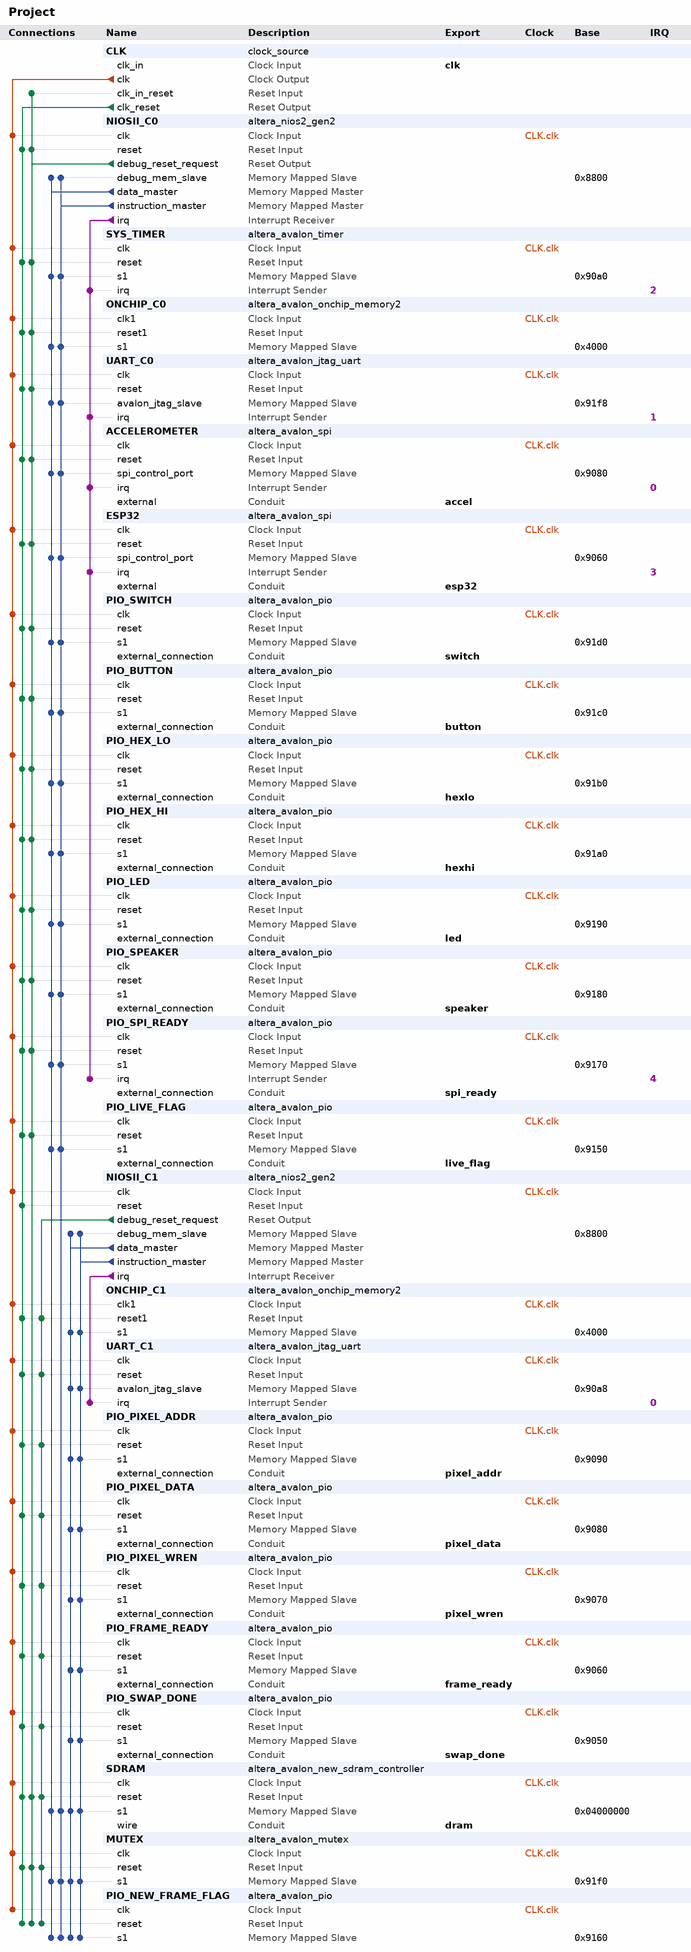
[diagram p0: system contents]
# Platform Designer (Qsys) system Project, MAX 10 10M50DAF484C7G
# Parameters at their usual value, and those the tool derives, are not listed.
package require -exact qsys 23.1
create_system Project
set_project_property DEVICE_FAMILY {MAX 10}
set_project_property DEVICE 10M50DAF484C7G

add_instance CLK clock_source 23.1
set_instance_parameter_value CLK clockFrequency 50000000

add_instance NIOSII_C0 altera_nios2_gen2 23.1
set_instance_parameter_value NIOSII_C0 dcache_size 2048
set_instance_parameter_value NIOSII_C0 exceptionSlave ONCHIP_C0.s1
set_instance_parameter_value NIOSII_C0 icache_size 4096
set_instance_parameter_value NIOSII_C0 impl Fast
set_instance_parameter_value NIOSII_C0 resetSlave ONCHIP_C0.s1

add_instance SYS_TIMER altera_avalon_timer 23.1
set_instance_parameter_value SYS_TIMER alwaysRun true
set_instance_parameter_value SYS_TIMER fixedPeriod true
set_instance_parameter_value SYS_TIMER period 1
set_instance_parameter_value SYS_TIMER periodUnits MSEC

add_instance ONCHIP_C0 altera_avalon_onchip_memory2 23.1
set_instance_parameter_value ONCHIP_C0 dataWidth 32
set_instance_parameter_value ONCHIP_C0 dualPort false
set_instance_parameter_value ONCHIP_C0 initMemContent false
set_instance_parameter_value ONCHIP_C0 initializationFileName onchip_mem.hex
set_instance_parameter_value ONCHIP_C0 memorySize 16384

add_instance UART_C0 altera_avalon_jtag_uart 23.1
set_instance_parameter_value UART_C0 simInteractiveOptions NO_INTERACTIVE_WINDOWS

add_instance ACCELEROMETER altera_avalon_spi 23.1
set_instance_parameter_value ACCELEROMETER clockPhase 1
set_instance_parameter_value ACCELEROMETER clockPolarity 1
set_instance_parameter_value ACCELEROMETER dataWidth 8
set_instance_parameter_value ACCELEROMETER masterSPI true
set_instance_parameter_value ACCELEROMETER numberOfSlaves 1
set_instance_parameter_value ACCELEROMETER targetClockRate 128000

add_instance ESP32 altera_avalon_spi 23.1
set_instance_parameter_value ESP32 clockPolarity 0
set_instance_parameter_value ESP32 dataWidth 8
set_instance_parameter_value ESP32 masterSPI true
set_instance_parameter_value ESP32 numberOfSlaves 1
set_instance_parameter_value ESP32 targetClockRate 600000000

add_instance PIO_SWITCH altera_avalon_pio 23.1
set_instance_parameter_value PIO_SWITCH direction Input
set_instance_parameter_value PIO_SWITCH width 5

add_instance PIO_BUTTON altera_avalon_pio 23.1
set_instance_parameter_value PIO_BUTTON direction Input
set_instance_parameter_value PIO_BUTTON edgeType FALLING
set_instance_parameter_value PIO_BUTTON width 2

add_instance PIO_HEX_LO altera_avalon_pio 23.1
set_instance_parameter_value PIO_HEX_LO direction Output
set_instance_parameter_value PIO_HEX_LO width 24

add_instance PIO_HEX_HI altera_avalon_pio 23.1
set_instance_parameter_value PIO_HEX_HI direction Output
set_instance_parameter_value PIO_HEX_HI width 24

add_instance PIO_LED altera_avalon_pio 23.1
set_instance_parameter_value PIO_LED direction Output
set_instance_parameter_value PIO_LED width 5

add_instance PIO_SPEAKER altera_avalon_pio 23.1
set_instance_parameter_value PIO_SPEAKER direction Output
set_instance_parameter_value PIO_SPEAKER width 1

add_instance PIO_SPI_READY altera_avalon_pio 23.1
set_instance_parameter_value PIO_SPI_READY captureEdge true
set_instance_parameter_value PIO_SPI_READY direction Input
set_instance_parameter_value PIO_SPI_READY generateIRQ true
set_instance_parameter_value PIO_SPI_READY irqType EDGE
set_instance_parameter_value PIO_SPI_READY width 1

add_instance PIO_LIVE_FLAG altera_avalon_pio 23.1
set_instance_parameter_value PIO_LIVE_FLAG direction Output
set_instance_parameter_value PIO_LIVE_FLAG width 1

add_instance NIOSII_C1 altera_nios2_gen2 23.1
set_instance_parameter_value NIOSII_C1 cpuID 1
set_instance_parameter_value NIOSII_C1 dcache_size 2048
set_instance_parameter_value NIOSII_C1 exceptionSlave ONCHIP_C1.s1
set_instance_parameter_value NIOSII_C1 icache_size 4096
set_instance_parameter_value NIOSII_C1 impl Fast
set_instance_parameter_value NIOSII_C1 resetSlave ONCHIP_C1.s1

add_instance ONCHIP_C1 altera_avalon_onchip_memory2 23.1
set_instance_parameter_value ONCHIP_C1 dataWidth 32
set_instance_parameter_value ONCHIP_C1 dualPort false
set_instance_parameter_value ONCHIP_C1 initMemContent false
set_instance_parameter_value ONCHIP_C1 initializationFileName onchip_mem.hex
set_instance_parameter_value ONCHIP_C1 memorySize 16384

add_instance UART_C1 altera_avalon_jtag_uart 23.1
set_instance_parameter_value UART_C1 simInteractiveOptions NO_INTERACTIVE_WINDOWS

add_instance PIO_PIXEL_ADDR altera_avalon_pio 23.1
set_instance_parameter_value PIO_PIXEL_ADDR direction Output
set_instance_parameter_value PIO_PIXEL_ADDR width 17

add_instance PIO_PIXEL_DATA altera_avalon_pio 23.1
set_instance_parameter_value PIO_PIXEL_DATA direction Output
set_instance_parameter_value PIO_PIXEL_DATA width 12

add_instance PIO_PIXEL_WREN altera_avalon_pio 23.1
set_instance_parameter_value PIO_PIXEL_WREN direction Output
set_instance_parameter_value PIO_PIXEL_WREN width 1

add_instance PIO_FRAME_READY altera_avalon_pio 23.1
set_instance_parameter_value PIO_FRAME_READY direction Output
set_instance_parameter_value PIO_FRAME_READY width 1

add_instance PIO_SWAP_DONE altera_avalon_pio 23.1
set_instance_parameter_value PIO_SWAP_DONE direction Input
set_instance_parameter_value PIO_SWAP_DONE width 8

add_instance SDRAM altera_avalon_new_sdram_controller 20.1
set_instance_parameter_value SDRAM TAC 5.5
set_instance_parameter_value SDRAM TRCD 20.0
set_instance_parameter_value SDRAM TRP 20.0
set_instance_parameter_value SDRAM casLatency 3
set_instance_parameter_value SDRAM columnWidth 10
set_instance_parameter_value SDRAM dataWidth 16
set_instance_parameter_value SDRAM generateSimulationModel false
set_instance_parameter_value SDRAM model single_Micron_MT48LC4M32B2_7_chip
set_instance_parameter_value SDRAM numberOfBanks 4
set_instance_parameter_value SDRAM numberOfChipSelects 1
set_instance_parameter_value SDRAM powerUpDelay 100.0
set_instance_parameter_value SDRAM refreshPeriod 15.625
set_instance_parameter_value SDRAM rowWidth 13

add_instance MUTEX altera_avalon_mutex 23.1

add_instance PIO_NEW_FRAME_FLAG altera_avalon_pio 23.1
set_instance_parameter_value PIO_NEW_FRAME_FLAG direction Output
set_instance_parameter_value PIO_NEW_FRAME_FLAG width 1

# connections
add_connection CLK.clk ACCELEROMETER.clk clock
add_connection CLK.clk ESP32.clk clock
add_connection CLK.clk MUTEX.clk clock
add_connection CLK.clk NIOSII_C0.clk clock
add_connection CLK.clk NIOSII_C1.clk clock
add_connection CLK.clk ONCHIP_C0.clk1 clock
add_connection CLK.clk ONCHIP_C1.clk1 clock
add_connection CLK.clk PIO_BUTTON.clk clock
add_connection CLK.clk PIO_FRAME_READY.clk clock
add_connection CLK.clk PIO_HEX_HI.clk clock
add_connection CLK.clk PIO_HEX_LO.clk clock
add_connection CLK.clk PIO_LED.clk clock
add_connection CLK.clk PIO_LIVE_FLAG.clk clock
add_connection CLK.clk PIO_NEW_FRAME_FLAG.clk clock
add_connection CLK.clk PIO_PIXEL_ADDR.clk clock
add_connection CLK.clk PIO_PIXEL_DATA.clk clock
add_connection CLK.clk PIO_PIXEL_WREN.clk clock
add_connection CLK.clk PIO_SPEAKER.clk clock
add_connection CLK.clk PIO_SPI_READY.clk clock
add_connection CLK.clk PIO_SWAP_DONE.clk clock
add_connection CLK.clk PIO_SWITCH.clk clock
add_connection CLK.clk SDRAM.clk clock
add_connection CLK.clk SYS_TIMER.clk clock
add_connection CLK.clk UART_C0.clk clock
add_connection CLK.clk UART_C1.clk clock
add_connection CLK.clk_reset ACCELEROMETER.reset reset
add_connection CLK.clk_reset ESP32.reset reset
add_connection CLK.clk_reset MUTEX.reset reset
add_connection CLK.clk_reset NIOSII_C0.reset reset
add_connection CLK.clk_reset NIOSII_C1.reset reset
add_connection CLK.clk_reset ONCHIP_C0.reset1 reset
add_connection CLK.clk_reset ONCHIP_C1.reset1 reset
add_connection CLK.clk_reset PIO_BUTTON.reset reset
add_connection CLK.clk_reset PIO_FRAME_READY.reset reset
add_connection CLK.clk_reset PIO_HEX_HI.reset reset
add_connection CLK.clk_reset PIO_HEX_LO.reset reset
add_connection CLK.clk_reset PIO_LED.reset reset
add_connection CLK.clk_reset PIO_LIVE_FLAG.reset reset
add_connection CLK.clk_reset PIO_NEW_FRAME_FLAG.reset reset
add_connection CLK.clk_reset PIO_PIXEL_ADDR.reset reset
add_connection CLK.clk_reset PIO_PIXEL_DATA.reset reset
add_connection CLK.clk_reset PIO_PIXEL_WREN.reset reset
add_connection CLK.clk_reset PIO_SPEAKER.reset reset
add_connection CLK.clk_reset PIO_SPI_READY.reset reset
add_connection CLK.clk_reset PIO_SWAP_DONE.reset reset
add_connection CLK.clk_reset PIO_SWITCH.reset reset
add_connection CLK.clk_reset SDRAM.reset reset
add_connection CLK.clk_reset SYS_TIMER.reset reset
add_connection CLK.clk_reset UART_C0.reset reset
add_connection CLK.clk_reset UART_C1.reset reset
add_connection NIOSII_C0.debug_reset_request ACCELEROMETER.reset reset
add_connection NIOSII_C0.debug_reset_request CLK.clk_in_reset reset
add_connection NIOSII_C0.debug_reset_request ESP32.reset reset
add_connection NIOSII_C0.debug_reset_request MUTEX.reset reset
add_connection NIOSII_C0.debug_reset_request NIOSII_C0.reset reset
add_connection NIOSII_C0.debug_reset_request ONCHIP_C0.reset1 reset
add_connection NIOSII_C0.debug_reset_request PIO_BUTTON.reset reset
add_connection NIOSII_C0.debug_reset_request PIO_HEX_HI.reset reset
add_connection NIOSII_C0.debug_reset_request PIO_HEX_LO.reset reset
add_connection NIOSII_C0.debug_reset_request PIO_LED.reset reset
add_connection NIOSII_C0.debug_reset_request PIO_LIVE_FLAG.reset reset
add_connection NIOSII_C0.debug_reset_request PIO_NEW_FRAME_FLAG.reset reset
add_connection NIOSII_C0.debug_reset_request PIO_SPEAKER.reset reset
add_connection NIOSII_C0.debug_reset_request PIO_SPI_READY.reset reset
add_connection NIOSII_C0.debug_reset_request PIO_SWITCH.reset reset
add_connection NIOSII_C0.debug_reset_request SDRAM.reset reset
add_connection NIOSII_C0.debug_reset_request SYS_TIMER.reset reset
add_connection NIOSII_C0.debug_reset_request UART_C0.reset reset
add_connection NIOSII_C1.debug_reset_request MUTEX.reset reset
add_connection NIOSII_C1.debug_reset_request ONCHIP_C1.reset1 reset
add_connection NIOSII_C1.debug_reset_request PIO_FRAME_READY.reset reset
add_connection NIOSII_C1.debug_reset_request PIO_NEW_FRAME_FLAG.reset reset
add_connection NIOSII_C1.debug_reset_request PIO_PIXEL_ADDR.reset reset
add_connection NIOSII_C1.debug_reset_request PIO_PIXEL_DATA.reset reset
add_connection NIOSII_C1.debug_reset_request PIO_PIXEL_WREN.reset reset
add_connection NIOSII_C1.debug_reset_request PIO_SWAP_DONE.reset reset
add_connection NIOSII_C1.debug_reset_request SDRAM.reset reset
add_connection NIOSII_C1.debug_reset_request UART_C1.reset reset
add_connection NIOSII_C0.data_master ACCELEROMETER.spi_control_port avalon
set_connection_parameter_value NIOSII_C0.data_master/ACCELEROMETER.spi_control_port baseAddress 0x9080
add_connection NIOSII_C0.data_master ESP32.spi_control_port avalon
set_connection_parameter_value NIOSII_C0.data_master/ESP32.spi_control_port baseAddress 0x9060
add_connection NIOSII_C0.data_master MUTEX.s1 avalon
set_connection_parameter_value NIOSII_C0.data_master/MUTEX.s1 baseAddress 0x91f0
add_connection NIOSII_C0.data_master NIOSII_C0.debug_mem_slave avalon
set_connection_parameter_value NIOSII_C0.data_master/NIOSII_C0.debug_mem_slave baseAddress 0x8800
add_connection NIOSII_C0.data_master ONCHIP_C0.s1 avalon
set_connection_parameter_value NIOSII_C0.data_master/ONCHIP_C0.s1 baseAddress 0x4000
add_connection NIOSII_C0.data_master PIO_BUTTON.s1 avalon
set_connection_parameter_value NIOSII_C0.data_master/PIO_BUTTON.s1 baseAddress 0x91c0
add_connection NIOSII_C0.data_master PIO_HEX_HI.s1 avalon
set_connection_parameter_value NIOSII_C0.data_master/PIO_HEX_HI.s1 baseAddress 0x91a0
add_connection NIOSII_C0.data_master PIO_HEX_LO.s1 avalon
set_connection_parameter_value NIOSII_C0.data_master/PIO_HEX_LO.s1 baseAddress 0x91b0
add_connection NIOSII_C0.data_master PIO_LED.s1 avalon
set_connection_parameter_value NIOSII_C0.data_master/PIO_LED.s1 baseAddress 0x9190
add_connection NIOSII_C0.data_master PIO_LIVE_FLAG.s1 avalon
set_connection_parameter_value NIOSII_C0.data_master/PIO_LIVE_FLAG.s1 baseAddress 0x9150
add_connection NIOSII_C0.data_master PIO_NEW_FRAME_FLAG.s1 avalon
set_connection_parameter_value NIOSII_C0.data_master/PIO_NEW_FRAME_FLAG.s1 baseAddress 0x9160
add_connection NIOSII_C0.data_master PIO_SPEAKER.s1 avalon
set_connection_parameter_value NIOSII_C0.data_master/PIO_SPEAKER.s1 baseAddress 0x9180
add_connection NIOSII_C0.data_master PIO_SPI_READY.s1 avalon
set_connection_parameter_value NIOSII_C0.data_master/PIO_SPI_READY.s1 baseAddress 0x9170
add_connection NIOSII_C0.data_master PIO_SWITCH.s1 avalon
set_connection_parameter_value NIOSII_C0.data_master/PIO_SWITCH.s1 baseAddress 0x91d0
add_connection NIOSII_C0.data_master SDRAM.s1 avalon
set_connection_parameter_value NIOSII_C0.data_master/SDRAM.s1 baseAddress 0x04000000
add_connection NIOSII_C0.data_master SYS_TIMER.s1 avalon
set_connection_parameter_value NIOSII_C0.data_master/SYS_TIMER.s1 baseAddress 0x90a0
add_connection NIOSII_C0.data_master UART_C0.avalon_jtag_slave avalon
set_connection_parameter_value NIOSII_C0.data_master/UART_C0.avalon_jtag_slave baseAddress 0x91f8
add_connection NIOSII_C0.instruction_master ACCELEROMETER.spi_control_port avalon
set_connection_parameter_value NIOSII_C0.instruction_master/ACCELEROMETER.spi_control_port baseAddress 0x9080
add_connection NIOSII_C0.instruction_master ESP32.spi_control_port avalon
set_connection_parameter_value NIOSII_C0.instruction_master/ESP32.spi_control_port baseAddress 0x9060
add_connection NIOSII_C0.instruction_master MUTEX.s1 avalon
set_connection_parameter_value NIOSII_C0.instruction_master/MUTEX.s1 baseAddress 0x91f0
add_connection NIOSII_C0.instruction_master NIOSII_C0.debug_mem_slave avalon
set_connection_parameter_value NIOSII_C0.instruction_master/NIOSII_C0.debug_mem_slave baseAddress 0x8800
add_connection NIOSII_C0.instruction_master ONCHIP_C0.s1 avalon
set_connection_parameter_value NIOSII_C0.instruction_master/ONCHIP_C0.s1 baseAddress 0x4000
add_connection NIOSII_C0.instruction_master PIO_BUTTON.s1 avalon
set_connection_parameter_value NIOSII_C0.instruction_master/PIO_BUTTON.s1 baseAddress 0x91c0
add_connection NIOSII_C0.instruction_master PIO_HEX_HI.s1 avalon
set_connection_parameter_value NIOSII_C0.instruction_master/PIO_HEX_HI.s1 baseAddress 0x91a0
add_connection NIOSII_C0.instruction_master PIO_HEX_LO.s1 avalon
set_connection_parameter_value NIOSII_C0.instruction_master/PIO_HEX_LO.s1 baseAddress 0x91b0
add_connection NIOSII_C0.instruction_master PIO_LED.s1 avalon
set_connection_parameter_value NIOSII_C0.instruction_master/PIO_LED.s1 baseAddress 0x9190
add_connection NIOSII_C0.instruction_master PIO_LIVE_FLAG.s1 avalon
set_connection_parameter_value NIOSII_C0.instruction_master/PIO_LIVE_FLAG.s1 baseAddress 0x9150
add_connection NIOSII_C0.instruction_master PIO_NEW_FRAME_FLAG.s1 avalon
set_connection_parameter_value NIOSII_C0.instruction_master/PIO_NEW_FRAME_FLAG.s1 baseAddress 0x9160
add_connection NIOSII_C0.instruction_master PIO_SPEAKER.s1 avalon
set_connection_parameter_value NIOSII_C0.instruction_master/PIO_SPEAKER.s1 baseAddress 0x9180
add_connection NIOSII_C0.instruction_master PIO_SPI_READY.s1 avalon
set_connection_parameter_value NIOSII_C0.instruction_master/PIO_SPI_READY.s1 baseAddress 0x9170
add_connection NIOSII_C0.instruction_master PIO_SWITCH.s1 avalon
set_connection_parameter_value NIOSII_C0.instruction_master/PIO_SWITCH.s1 baseAddress 0x91d0
add_connection NIOSII_C0.instruction_master SDRAM.s1 avalon
set_connection_parameter_value NIOSII_C0.instruction_master/SDRAM.s1 baseAddress 0x04000000
add_connection NIOSII_C0.instruction_master SYS_TIMER.s1 avalon
set_connection_parameter_value NIOSII_C0.instruction_master/SYS_TIMER.s1 baseAddress 0x90a0
add_connection NIOSII_C0.instruction_master UART_C0.avalon_jtag_slave avalon
set_connection_parameter_value NIOSII_C0.instruction_master/UART_C0.avalon_jtag_slave baseAddress 0x91f8
add_connection NIOSII_C1.data_master MUTEX.s1 avalon
set_connection_parameter_value NIOSII_C1.data_master/MUTEX.s1 baseAddress 0x91f0
add_connection NIOSII_C1.data_master NIOSII_C1.debug_mem_slave avalon
set_connection_parameter_value NIOSII_C1.data_master/NIOSII_C1.debug_mem_slave baseAddress 0x8800
add_connection NIOSII_C1.data_master ONCHIP_C1.s1 avalon
set_connection_parameter_value NIOSII_C1.data_master/ONCHIP_C1.s1 baseAddress 0x4000
add_connection NIOSII_C1.data_master PIO_FRAME_READY.s1 avalon
set_connection_parameter_value NIOSII_C1.data_master/PIO_FRAME_READY.s1 baseAddress 0x9060
add_connection NIOSII_C1.data_master PIO_NEW_FRAME_FLAG.s1 avalon
set_connection_parameter_value NIOSII_C1.data_master/PIO_NEW_FRAME_FLAG.s1 baseAddress 0x9160
add_connection NIOSII_C1.data_master PIO_PIXEL_ADDR.s1 avalon
set_connection_parameter_value NIOSII_C1.data_master/PIO_PIXEL_ADDR.s1 baseAddress 0x9090
add_connection NIOSII_C1.data_master PIO_PIXEL_DATA.s1 avalon
set_connection_parameter_value NIOSII_C1.data_master/PIO_PIXEL_DATA.s1 baseAddress 0x9080
add_connection NIOSII_C1.data_master PIO_PIXEL_WREN.s1 avalon
set_connection_parameter_value NIOSII_C1.data_master/PIO_PIXEL_WREN.s1 baseAddress 0x9070
add_connection NIOSII_C1.data_master PIO_SWAP_DONE.s1 avalon
set_connection_parameter_value NIOSII_C1.data_master/PIO_SWAP_DONE.s1 baseAddress 0x9050
add_connection NIOSII_C1.data_master SDRAM.s1 avalon
set_connection_parameter_value NIOSII_C1.data_master/SDRAM.s1 baseAddress 0x04000000
add_connection NIOSII_C1.data_master UART_C1.avalon_jtag_slave avalon
set_connection_parameter_value NIOSII_C1.data_master/UART_C1.avalon_jtag_slave baseAddress 0x90a8
add_connection NIOSII_C1.instruction_master MUTEX.s1 avalon
set_connection_parameter_value NIOSII_C1.instruction_master/MUTEX.s1 baseAddress 0x91f0
add_connection NIOSII_C1.instruction_master NIOSII_C1.debug_mem_slave avalon
set_connection_parameter_value NIOSII_C1.instruction_master/NIOSII_C1.debug_mem_slave baseAddress 0x8800
add_connection NIOSII_C1.instruction_master ONCHIP_C1.s1 avalon
set_connection_parameter_value NIOSII_C1.instruction_master/ONCHIP_C1.s1 baseAddress 0x4000
add_connection NIOSII_C1.instruction_master PIO_FRAME_READY.s1 avalon
set_connection_parameter_value NIOSII_C1.instruction_master/PIO_FRAME_READY.s1 baseAddress 0x9060
add_connection NIOSII_C1.instruction_master PIO_NEW_FRAME_FLAG.s1 avalon
set_connection_parameter_value NIOSII_C1.instruction_master/PIO_NEW_FRAME_FLAG.s1 baseAddress 0x9160
add_connection NIOSII_C1.instruction_master PIO_PIXEL_ADDR.s1 avalon
set_connection_parameter_value NIOSII_C1.instruction_master/PIO_PIXEL_ADDR.s1 baseAddress 0x9090
add_connection NIOSII_C1.instruction_master PIO_PIXEL_DATA.s1 avalon
set_connection_parameter_value NIOSII_C1.instruction_master/PIO_PIXEL_DATA.s1 baseAddress 0x9080
add_connection NIOSII_C1.instruction_master PIO_PIXEL_WREN.s1 avalon
set_connection_parameter_value NIOSII_C1.instruction_master/PIO_PIXEL_WREN.s1 baseAddress 0x9070
add_connection NIOSII_C1.instruction_master PIO_SWAP_DONE.s1 avalon
set_connection_parameter_value NIOSII_C1.instruction_master/PIO_SWAP_DONE.s1 baseAddress 0x9050
add_connection NIOSII_C1.instruction_master SDRAM.s1 avalon
set_connection_parameter_value NIOSII_C1.instruction_master/SDRAM.s1 baseAddress 0x04000000
add_connection NIOSII_C1.instruction_master UART_C1.avalon_jtag_slave avalon
set_connection_parameter_value NIOSII_C1.instruction_master/UART_C1.avalon_jtag_slave baseAddress 0x90a8
add_connection NIOSII_C0.irq ACCELEROMETER.irq interrupt
set_connection_parameter_value NIOSII_C0.irq/ACCELEROMETER.irq irqNumber 0
add_connection NIOSII_C0.irq ESP32.irq interrupt
set_connection_parameter_value NIOSII_C0.irq/ESP32.irq irqNumber 3
add_connection NIOSII_C0.irq PIO_SPI_READY.irq interrupt
set_connection_parameter_value NIOSII_C0.irq/PIO_SPI_READY.irq irqNumber 4
add_connection NIOSII_C0.irq SYS_TIMER.irq interrupt
set_connection_parameter_value NIOSII_C0.irq/SYS_TIMER.irq irqNumber 2
add_connection NIOSII_C0.irq UART_C0.irq interrupt
set_connection_parameter_value NIOSII_C0.irq/UART_C0.irq irqNumber 1
add_connection NIOSII_C1.irq UART_C1.irq interrupt
set_connection_parameter_value NIOSII_C1.irq/UART_C1.irq irqNumber 0

# exported interfaces
add_interface accel conduit end
set_interface_property accel EXPORT_OF ACCELEROMETER.external
add_interface button conduit end
set_interface_property button EXPORT_OF PIO_BUTTON.external_connection
add_interface clk clock sink
set_interface_property clk EXPORT_OF CLK.clk_in
add_interface dram conduit end
set_interface_property dram EXPORT_OF SDRAM.wire
add_interface esp32 conduit end
set_interface_property esp32 EXPORT_OF ESP32.external
add_interface frame_ready conduit end
set_interface_property frame_ready EXPORT_OF PIO_FRAME_READY.external_connection
add_interface hexhi conduit end
set_interface_property hexhi EXPORT_OF PIO_HEX_HI.external_connection
add_interface hexlo conduit end
set_interface_property hexlo EXPORT_OF PIO_HEX_LO.external_connection
add_interface led conduit end
set_interface_property led EXPORT_OF PIO_LED.external_connection
add_interface live_flag conduit end
set_interface_property live_flag EXPORT_OF PIO_LIVE_FLAG.external_connection
add_interface pixel_addr conduit end
set_interface_property pixel_addr EXPORT_OF PIO_PIXEL_ADDR.external_connection
add_interface pixel_data conduit end
set_interface_property pixel_data EXPORT_OF PIO_PIXEL_DATA.external_connection
add_interface pixel_wren conduit end
set_interface_property pixel_wren EXPORT_OF PIO_PIXEL_WREN.external_connection
add_interface speaker conduit end
set_interface_property speaker EXPORT_OF PIO_SPEAKER.external_connection
add_interface spi_ready conduit end
set_interface_property spi_ready EXPORT_OF PIO_SPI_READY.external_connection
add_interface swap_done conduit end
set_interface_property swap_done EXPORT_OF PIO_SWAP_DONE.external_connection
add_interface switch conduit end
set_interface_property switch EXPORT_OF PIO_SWITCH.external_connection

set_interconnect_requirement {$system} qsys_mm.clockCrossingAdapter HANDSHAKE
set_interconnect_requirement {$system} qsys_mm.enableEccProtection FALSE
set_interconnect_requirement {$system} qsys_mm.insertDefaultSlave FALSE
set_interconnect_requirement {$system} qsys_mm.maxAdditionalLatency 1

save_system Project.qsys
